# EasyEDA schematic SCH_Esp32-Breakout_2026-10-10.json
TITLE: Esp32Dek Kit Breakout; REV: 1.0; Date: 2021-06-17; Sheet: 1/1; Drawn By: Sven92; Company: Your Company
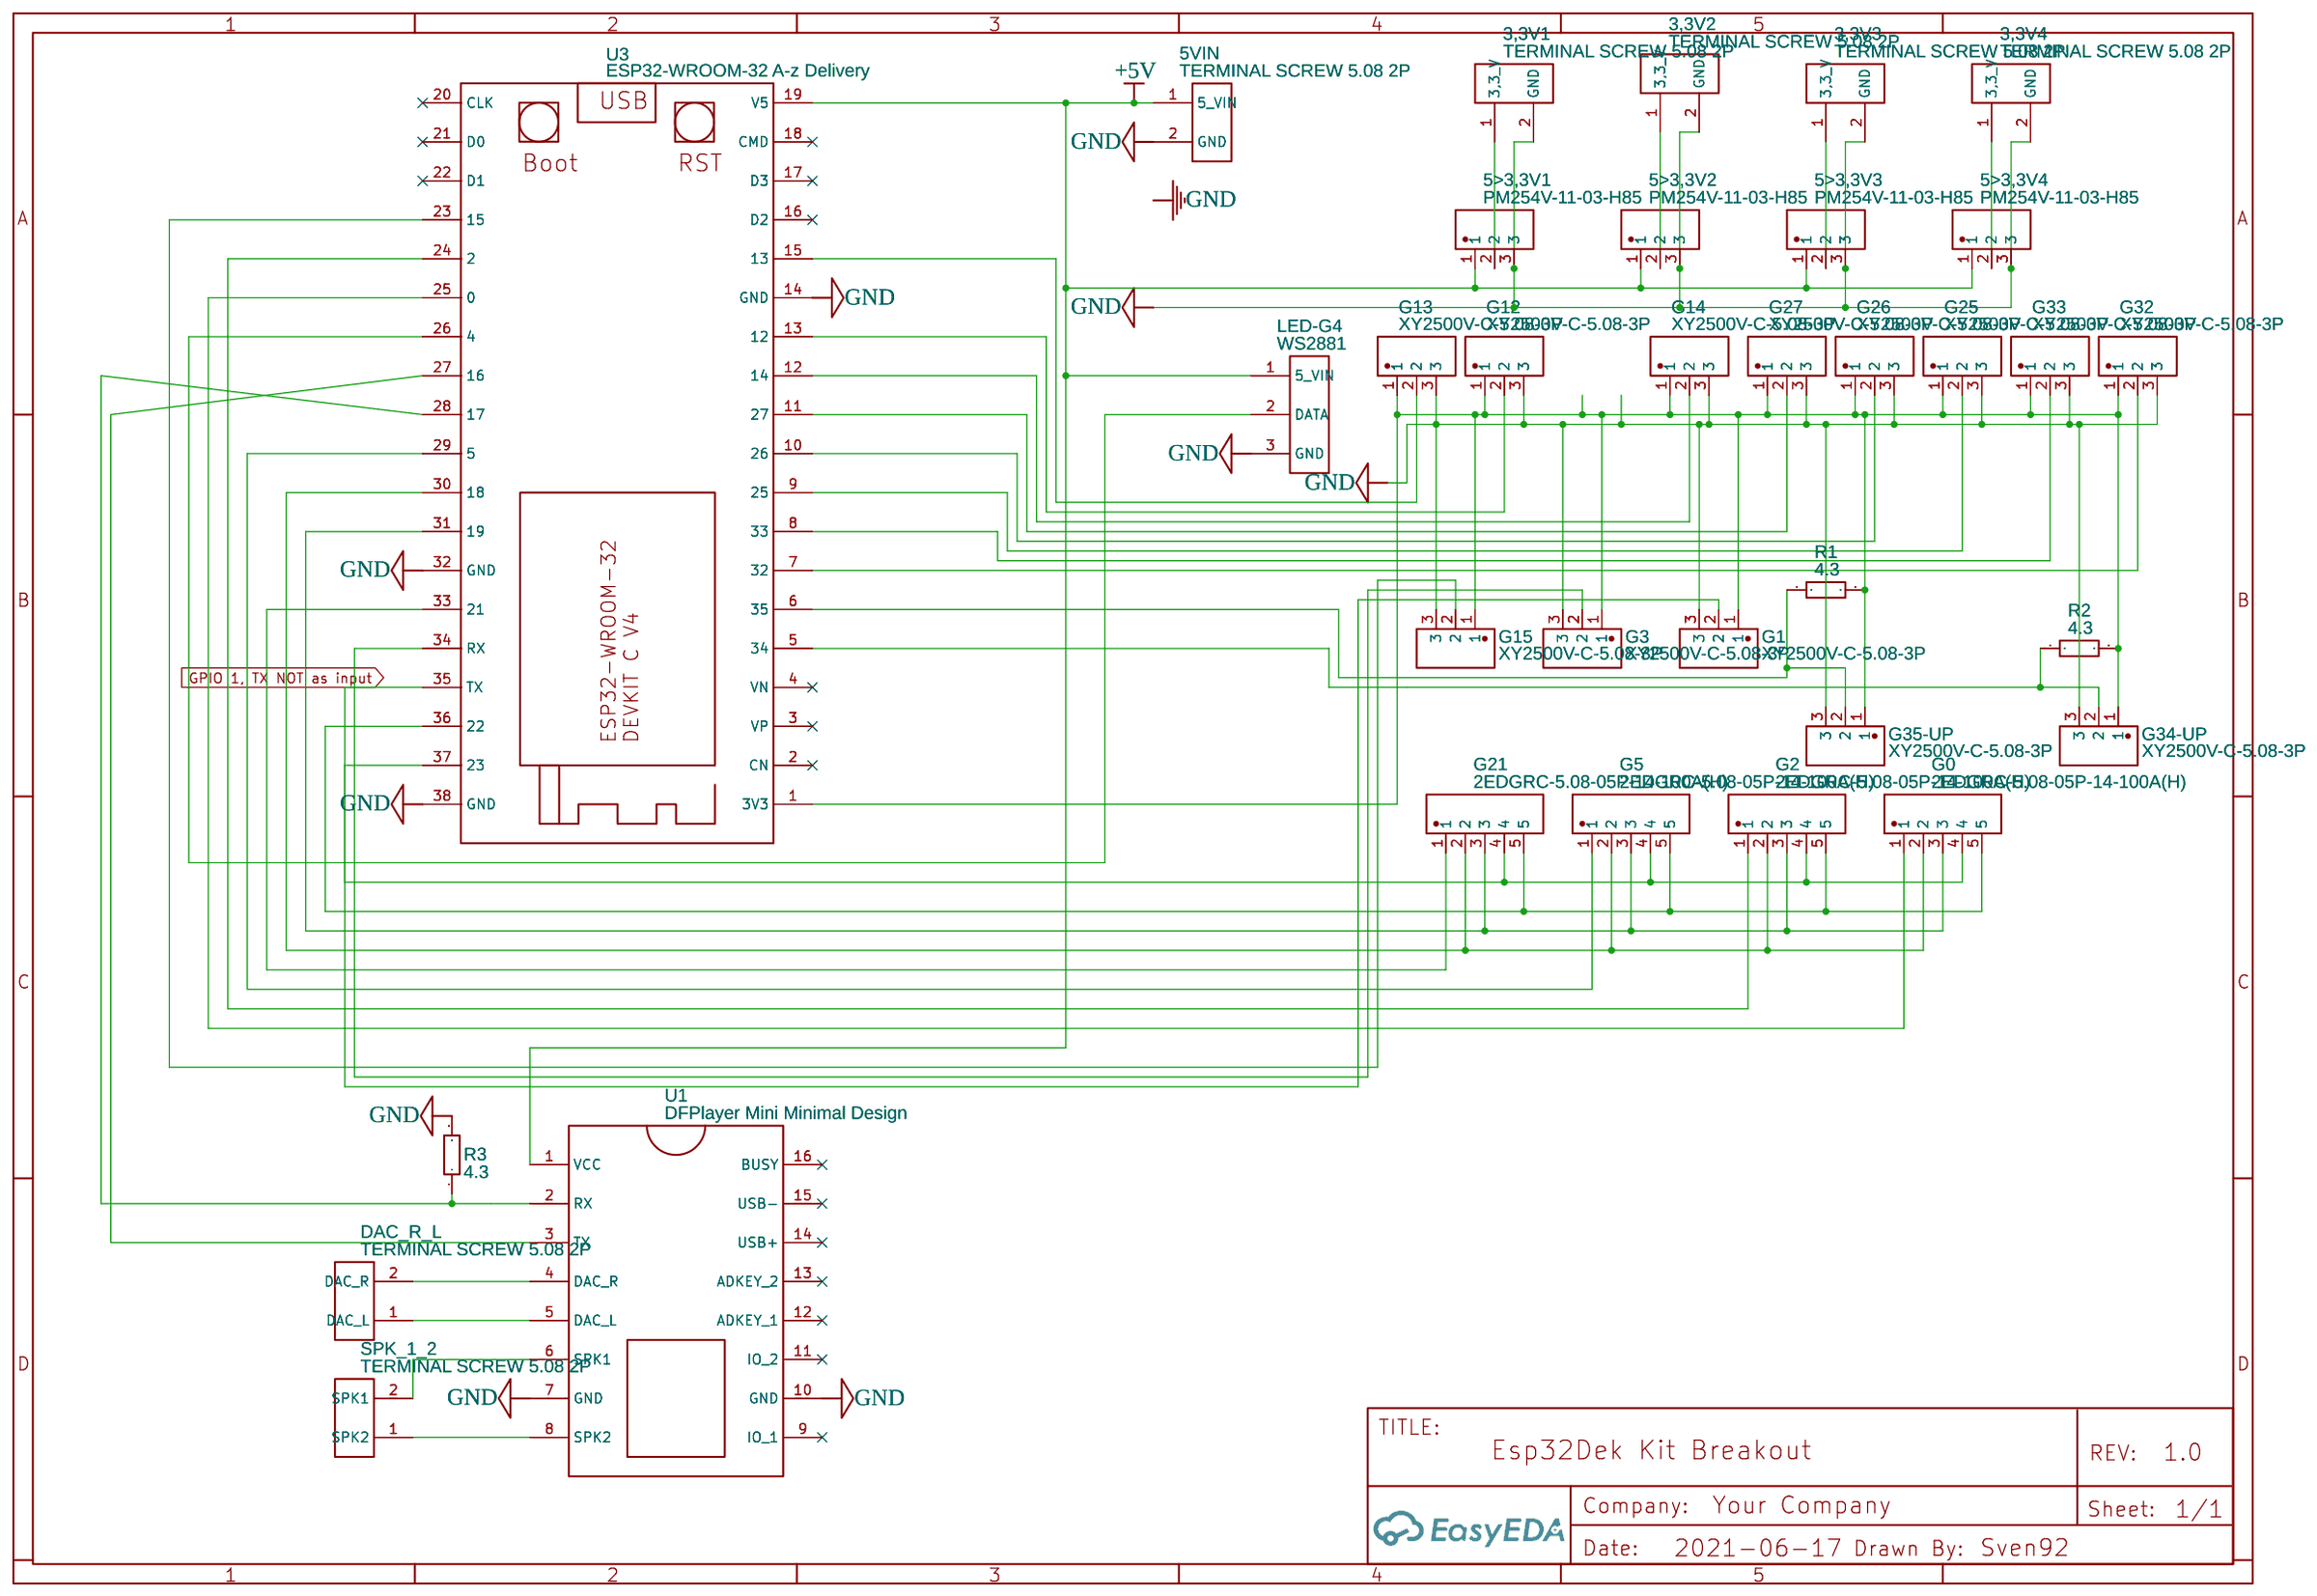
[diagram p0: schematic sheet]

## Parts
3,3V1  TERMINAL SCREW 5.08 2P  [TERMINAL SCREW 5.08 2P]
3,3V2  TERMINAL SCREW 5.08 2P  [TERMINAL SCREW 5.08 2P]
3,3V3  TERMINAL SCREW 5.08 2P  [TERMINAL SCREW 5.08 2P]
3,3V4  TERMINAL SCREW 5.08 2P  [TERMINAL SCREW 5.08 2P]
5>3,3V1  PM254V-11-03-H85  [HDR-TH_3P-P2.54-V-F]
5>3,3V2  PM254V-11-03-H85  [HDR-TH_3P-P2.54-V-F]
5>3,3V3  PM254V-11-03-H85  [HDR-TH_3P-P2.54-V-F]
5>3,3V4  PM254V-11-03-H85  [HDR-TH_3P-P2.54-V-F]
5VIN  TERMINAL SCREW 5.08 2P  [TERMINAL SCREW 5.08 2P]
DAC_R_L  TERMINAL SCREW 5.08 2P  [TERMINAL SCREW 5.08 2P]
G0  2EDGRC-5.08-05P-14-100A(H)  [CONN-TH_2EDGRC-5.08-05P-14-100A-H]
G1  XY2500V-C-5.08-3P  [CONN-TH_XY2500V-C-5.08-3P]
G2  2EDGRC-5.08-05P-14-100A(H)  [CONN-TH_2EDGRC-5.08-05P-14-100A-H]
G3  XY2500V-C-5.08-3P  [CONN-TH_XY2500V-C-5.08-3P]
G5  2EDGRC-5.08-05P-14-100A(H)  [CONN-TH_2EDGRC-5.08-05P-14-100A-H]
G12  XY2500V-C-5.08-3P  [CONN-TH_XY2500V-C-5.08-3P]
G13  XY2500V-C-5.08-3P  [CONN-TH_XY2500V-C-5.08-3P]
G14  XY2500V-C-5.08-3P  [CONN-TH_XY2500V-C-5.08-3P]
G15  XY2500V-C-5.08-3P  [CONN-TH_XY2500V-C-5.08-3P]
G21  2EDGRC-5.08-05P-14-100A(H)  [CONN-TH_2EDGRC-5.08-05P-14-100A-H]
G25  XY2500V-C-5.08-3P  [CONN-TH_XY2500V-C-5.08-3P]
G26  XY2500V-C-5.08-3P  [CONN-TH_XY2500V-C-5.08-3P]
G27  XY2500V-C-5.08-3P  [CONN-TH_XY2500V-C-5.08-3P]
G32  XY2500V-C-5.08-3P  [CONN-TH_XY2500V-C-5.08-3P]
G33  XY2500V-C-5.08-3P  [CONN-TH_XY2500V-C-5.08-3P]
G34-UP  XY2500V-C-5.08-3P  [CONN-TH_XY2500V-C-5.08-3P]
G35-UP  XY2500V-C-5.08-3P  [CONN-TH_XY2500V-C-5.08-3P]
LED-G4  WS2881  [TERMINAL SCREW 5.08 3P]
R1  4.3  [RES-TH_BD4.5-L11.5-P15.50-D0.7]
R2  4.3  [RES-TH_BD4.5-L11.5-P15.50-D0.7]
R3  4.3  [RES-TH_BD4.5-L11.5-P15.50-D0.7]
SPK_1_2  TERMINAL SCREW 5.08 2P  [TERMINAL SCREW 5.08 2P]
U1  DFPlayer Mini Minimal Design  [DF PLAYER MINI MINIMAL DESIGN]
U3  ESP32-WROOM-32 A-z Delivery  [AZ-DELIVERY NODEMCU ESP32 DEV KIT]

## Library data of the parts
3,3V1-3,3V4 5VIN DAC_R_L SPK_1_2 = TERMINAL SCREW 5.08 2P: Manufacturer Part: Screw terminal 2p; Contributor: reino.forward
5>3,3V1-5>3,3V4 = PM254V-11-03-H85: Supplier: LCSC; Supplier Part: C541850; Manufacturer: XFCN; Contributor: LCSC; JLCPCB Part Class: Extended Part
G0 G2 G5 G21 = 2EDGRC-5.08-05P-14-100A(H): Supplier: LCSC; Supplier Part: C669317; Manufacturer: DEGSON; Contributor: LCSC; JLCPCB Part Class: Extended Part
G1 G3 G12-G15 G25-G27 G32 G33 G34-UP G35-UP = XY2500V-C-5.08-3P: Supplier: LCSC; Supplier Part: C505771; Manufacturer: --; Contributor: LCSC; JLCPCB Part Class: Extended Part
LED-G4 = TERMINAL SCREW 5.08 3P: Manufacturer Part: Screw terminal 3p; Contributor: reino.forward
R1-R3 = MFR01SJ043JA10: Supplier: LCSC; Manufacturer: UniOhm; Supplier Part: C70757; JLCPCB Part Class: Extended Part
U1 = DFPlayer Mini Minimal Design: Manufacturer: DFRobot; Manufacturer Part: DFPlayer Mini SKU DFR0299; Supplier Part: SKU DFR0299; Supplier: DFRobot; link: https://wiki.dfrobot.com/DFPlayer_Mini_SKU_DFR0299; Contributor: Greal
U3 = ESP32-WROOM-32 A-z Delivery: Manufacturer Part: A-Z Delivery; Contributor: Neivydas Misiukonis; Supplier: Amazon; link: https://www.az-delivery.uk/products/esp32-developmentboard?variant=6119648460827

## Nets
+5V: 5>3,3V1.1 5>3,3V2.1 5>3,3V3.1 5>3,3V4.1 5VIN.1(5 VIN) LED-G4.1(5 VIN) U1.1(VCC) U3.19(V5)
GND: 3,3V1.2(GND) 3,3V2.2(GND) 3,3V3.2(GND) 3,3V4.2(GND) 5>3,3V1.3 5>3,3V2.3 5>3,3V3.3 5>3,3V4.3 5VIN.2(GND) G1.3 G3.3 G12.3 G13.3 G14.3 G15.3 G25.3 G26.3 G27.3 G32.3 G33.3 G34-UP.3 G35-UP.3 LED-G4.3(GND) R3.2 U1.7(GND) U1.10(GND) U3.14(GND) U3.32(GND) U3.38(GND)
Net-(3,3V1-1): 3,3V1.1(3,3 V) 5>3,3V1.2
Net-(3,3V2-1): 3,3V2.1(3,3 V) 5>3,3V2.2
Net-(3,3V3-1): 3,3V3.1(3,3 V) 5>3,3V3.2
Net-(3,3V4-1): 3,3V4.1(3,3 V) 5>3,3V4.2
Net-(DAC_R_L-1): DAC_R_L.1(DAC_L) U1.5(DAC_L)
Net-(DAC_R_L-2): DAC_R_L.2(DAC_R) U1.4(DAC_R)
Net-(G0-1): G0.1 U3.25(0)
Net-(G0-2): G0.2 G2.2 G5.2 G21.2 U3.30(18)
Net-(G0-3): G0.3 G2.3 G5.3 G21.3 U3.31(19)
Net-(G0-4): G0.4 G2.4 G5.4 G21.4 U3.37(23)
Net-(G0-5): G0.5 G2.5 G5.5 G21.5 U3.36(22)
Net-(G1-1): G1.1 G3.1 G12.1 G13.1 G14.1 G15.1 G25.1 G26.1 G27.1 G32.1 G33.1 G34-UP.1 G35-UP.1 R1.2 R2.2 U3.1(3V3)
Net-(G1-2): G1.2 U3.35(TX)
Net-(G2-1): G2.1 U3.24(2)
Net-(G3-2): G3.2 U3.34(RX)
Net-(G5-1): G5.1 U3.29(5)
Net-(G12-2): G12.2 U3.13(12)
Net-(G13-2): G13.2 U3.15(13)
Net-(G14-2): G14.2 U3.12(14)
Net-(G15-2): G15.2 U3.23(15)
Net-(G21-1): G21.1 U3.33(21)
Net-(G25-2): G25.2 U3.9(25)
Net-(G26-2): G26.2 U3.10(26)
Net-(G27-2): G27.2 U3.11(27)
Net-(G32-2): G32.2 U3.7(32)
Net-(G33-2): G33.2 U3.8(33)
Net-(G34-UP-2): G34-UP.2 R2.1 U3.5(34)
Net-(G35-UP-2): G35-UP.2 R1.1 U3.6(35)
Net-(LED-G4-2): LED-G4.2(DATA) U3.26(4)
Net-(R3-1): R3.1 U1.2(RX) U3.28(17)
Net-(SPK_1_2-1): SPK_1_2.1(SPK2) U1.8(SPK2)
Net-(SPK_1_2-2): SPK_1_2.2(SPK1) U1.6(SPK1)
Net-(U1-3): U1.3(TX) U3.27(16)

Not connected (* = marked no-connect by the designer): U1 9(IO_1)* 11(IO_2)* 12(ADKEY_1)* 13(ADKEY_2)* 14(USB+)* 15(USB-)* 16(BUSY)*; U3 2(CN)* 3(VP)* 4(VN)* 16(D2)* 17(D3)* 18(CMD)* 20(CLK)* 21(D0)* 22(D1)*
